# Altium schematic sheet 30_Radar_rail_selection_and_sensing.SchDoc
size 289 x 396 mm
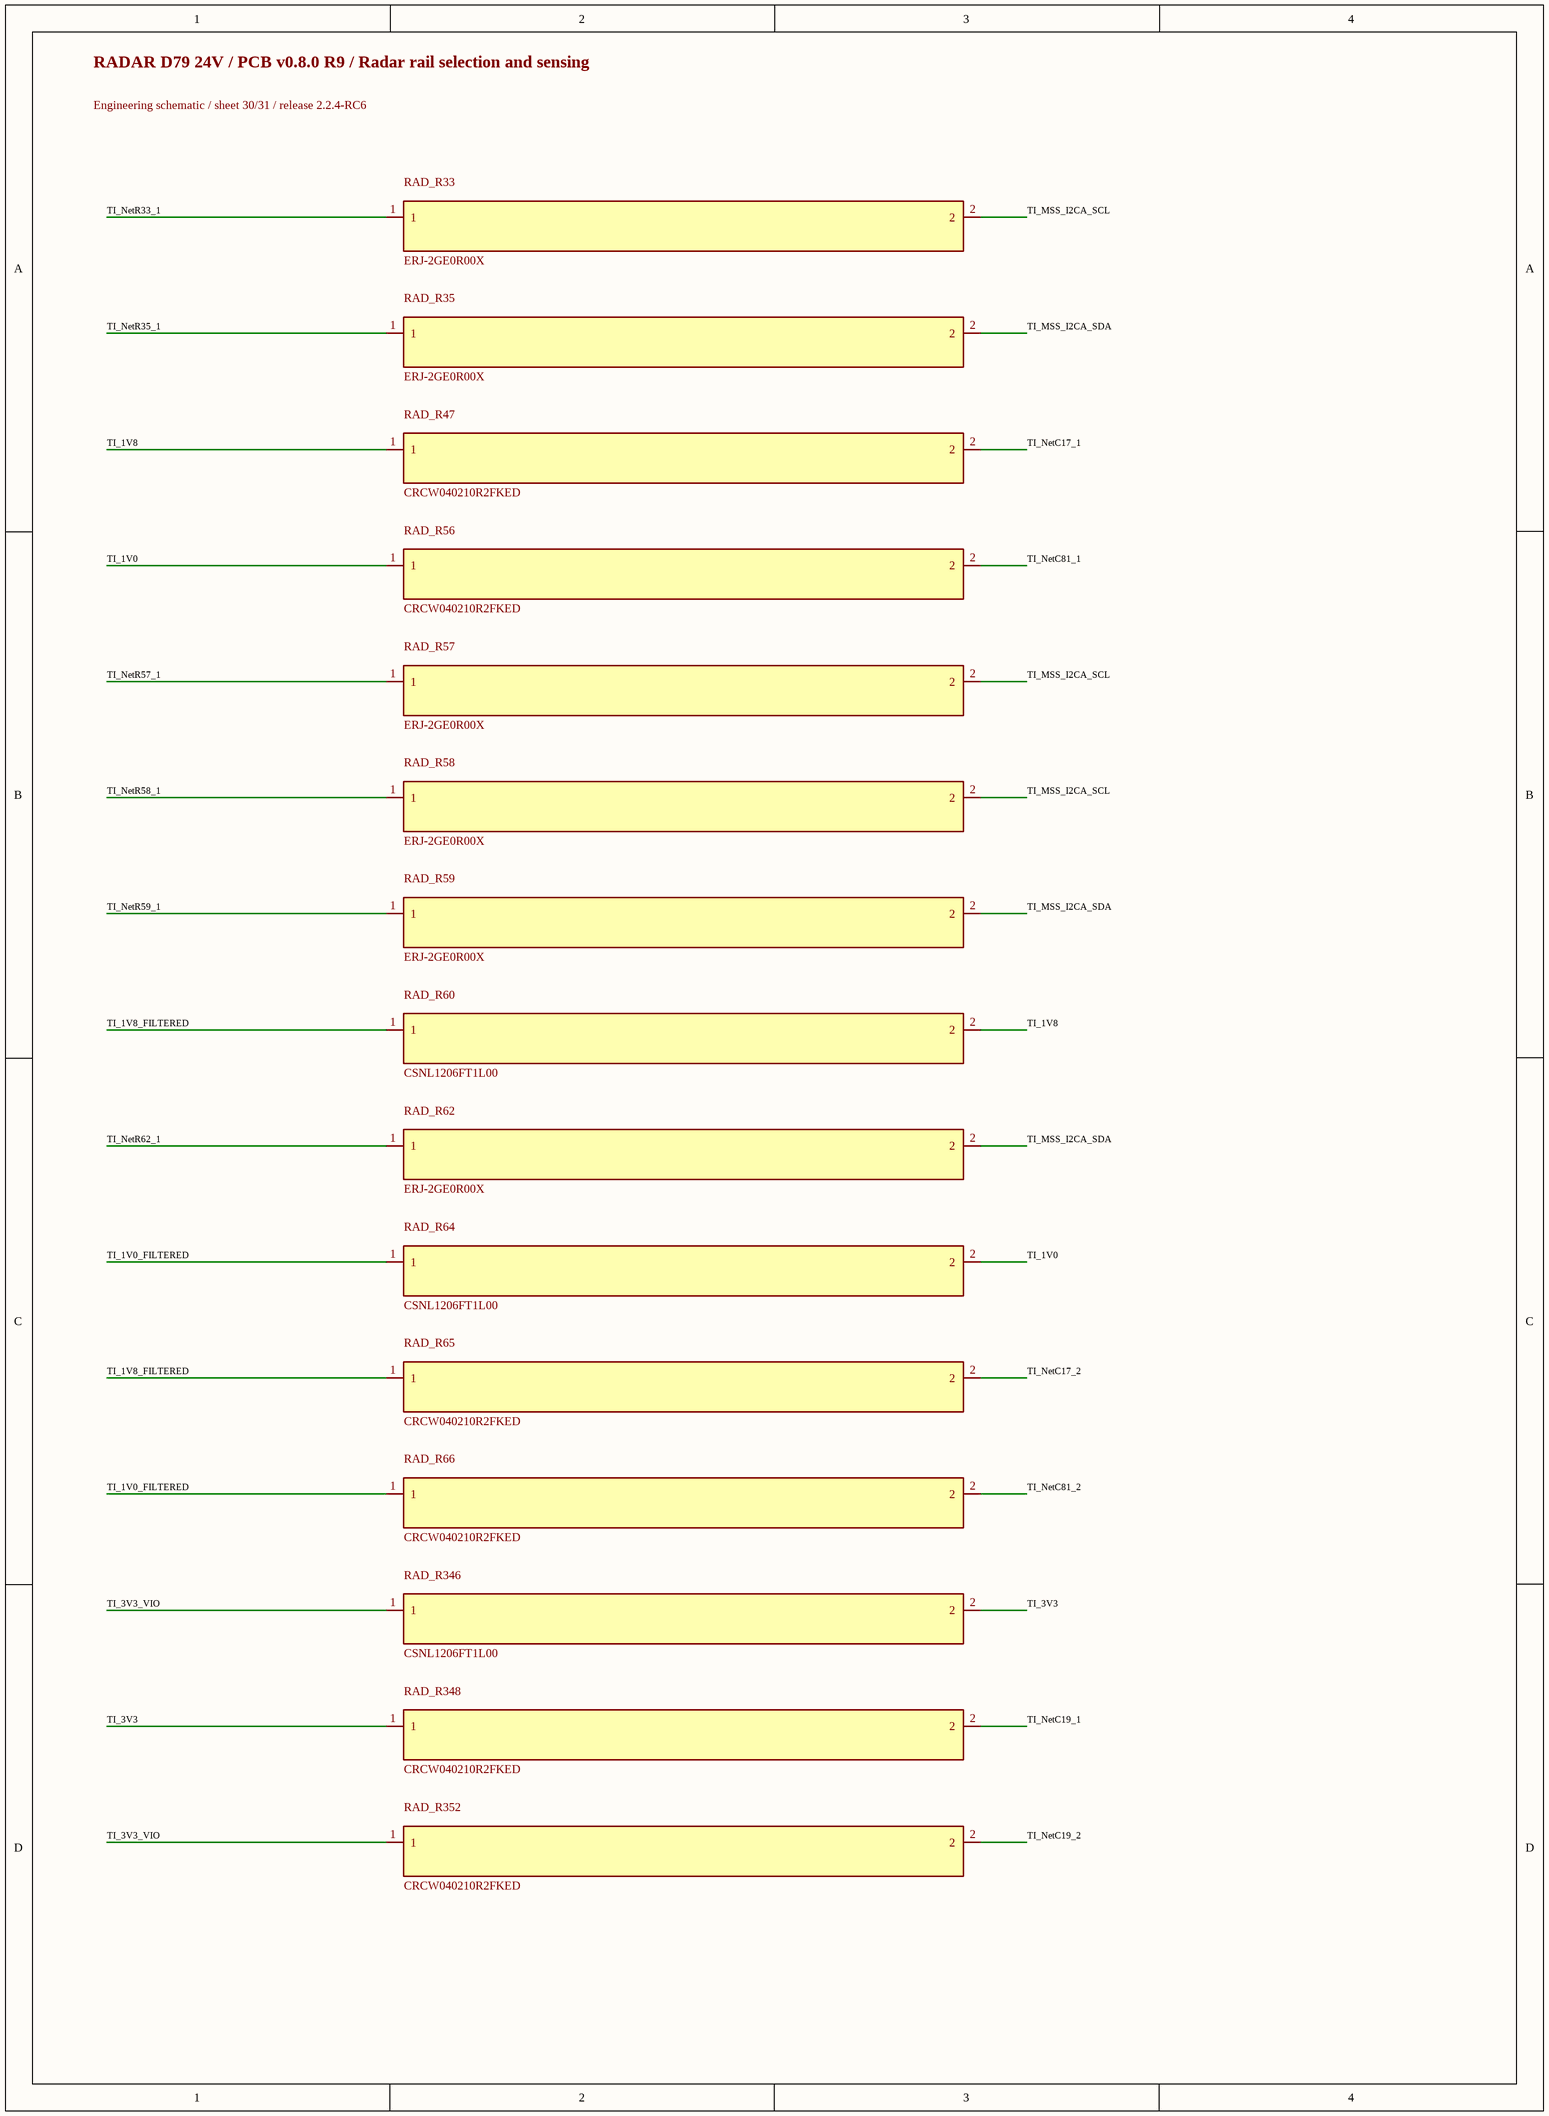
[diagram p0: 30_Radar_rail_selection_and_sensing.SchDoc]

## Parts
RAD_R33  ERJ-2GE0R00X  [0402L]
RAD_R35  ERJ-2GE0R00X  [0402L]
RAD_R47  CRCW040210R2FKED  [0402L]
RAD_R56  CRCW040210R2FKED  [0402L]
RAD_R57  ERJ-2GE0R00X  [0402L]
RAD_R58  ERJ-2GE0R00X  [0402L]
RAD_R59  ERJ-2GE0R00X  [0402L]
RAD_R60  CSNL1206FT1L00  [1206L]
RAD_R62  ERJ-2GE0R00X  [0402L]
RAD_R64  CSNL1206FT1L00  [1206L]
RAD_R65  CRCW040210R2FKED  [0402L]
RAD_R66  CRCW040210R2FKED  [0402L]
RAD_R346  CSNL1206FT1L00  [1206L]
RAD_R348  CRCW040210R2FKED  [0402L]
RAD_R352  CRCW040210R2FKED  [0402L]

## Nets
TI_1V0: RAD_R56.1 RAD_R64.2
TI_1V0_FILTERED: RAD_R64.1 RAD_R66.1
TI_1V8: RAD_R47.1 RAD_R60.2
TI_1V8_FILTERED: RAD_R60.1 RAD_R65.1
TI_3V3: RAD_R346.2 RAD_R348.1
TI_3V3_VIO: RAD_R346.1 RAD_R352.1
TI_MSS_I2CA_SCL: RAD_R33.2 RAD_R57.2 RAD_R58.2
TI_MSS_I2CA_SDA: RAD_R35.2 RAD_R59.2 RAD_R62.2
TI_NetC17_1: RAD_R47.2
TI_NetC17_2: RAD_R65.2
TI_NetC19_1: RAD_R348.2
TI_NetC19_2: RAD_R352.2
TI_NetC81_1: RAD_R56.2
TI_NetC81_2: RAD_R66.2
TI_NetR33_1: RAD_R33.1
TI_NetR35_1: RAD_R35.1
TI_NetR57_1: RAD_R57.1
TI_NetR58_1: RAD_R58.1
TI_NetR59_1: RAD_R59.1
TI_NetR62_1: RAD_R62.1

## Notes on the sheet
- RADAR D79 24V / PCB v0.8.0 R9 / Radar rail selection and sensing
- Engineering schematic / sheet 30/31 / release 2.2.4-RC6